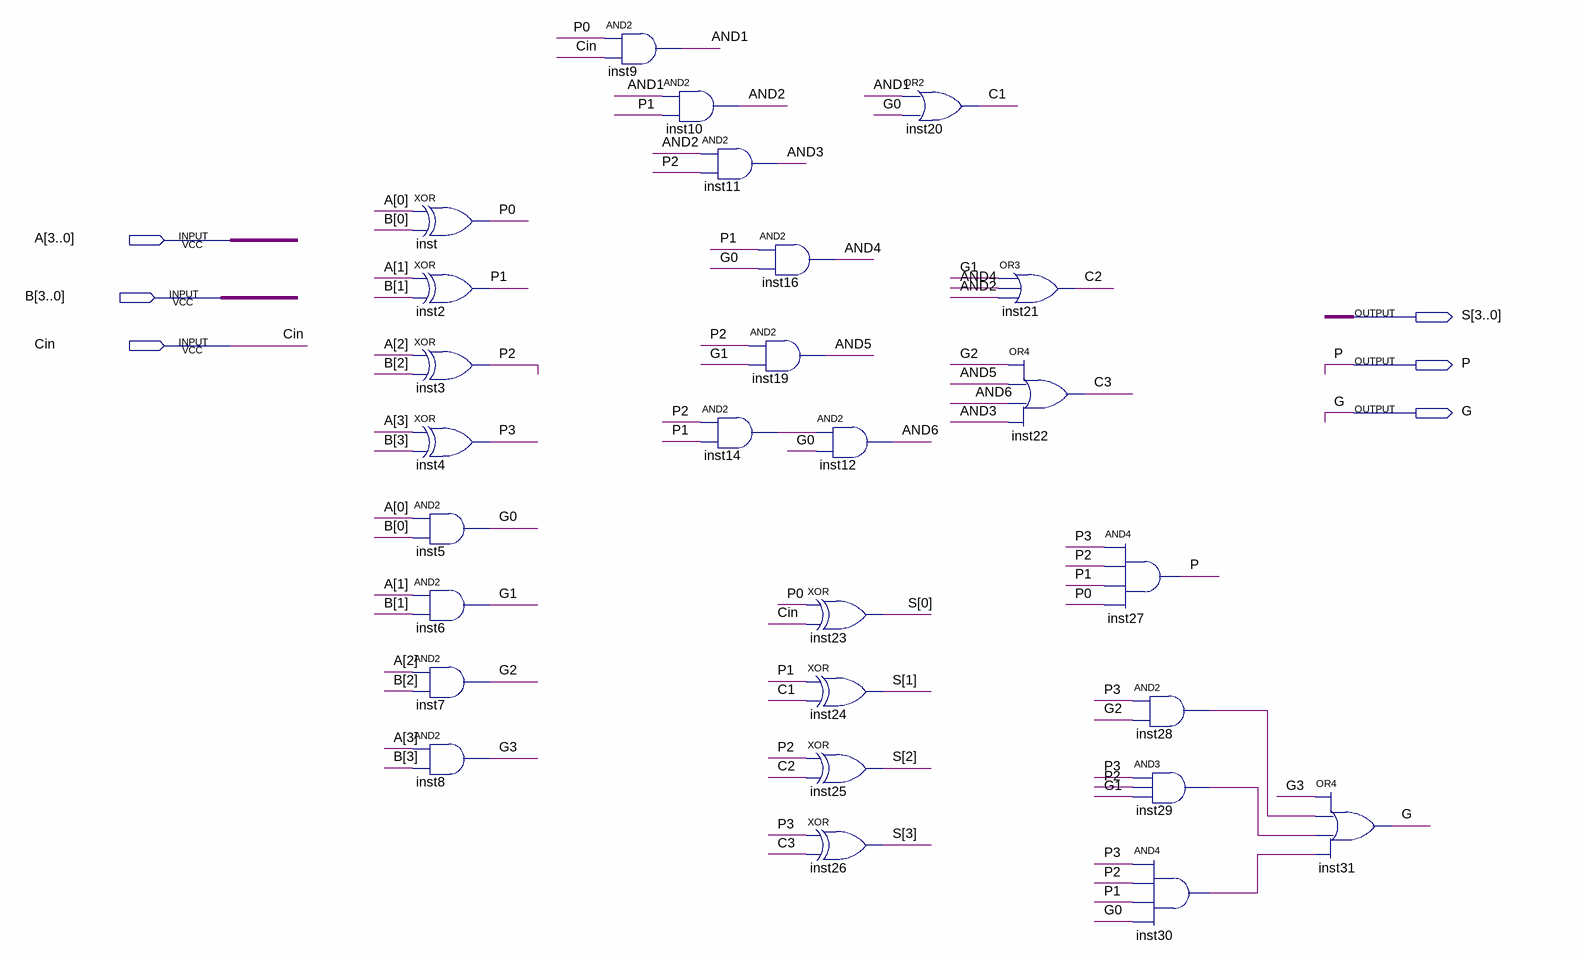
[diagram p0: schematic sheet]
// Quartus schematic CLA_4bit.bdf as structural Verilog: 27 symbols, 6 pins
module CLA_4bit (
  input  [3:0] A,
  input  [3:0] B,
  input  Cin,
  output [3:0] S,
  output P,
  output G
);

  wire AND1, AND2, AND3, AND4, AND5, AND6, C1, C2, C3, G0, G1, G2, G3, inst14_out, inst28_out, inst29_out,
       inst30_out, P0, P1, P2, P3;

  xor inst (P0, A[0], B[0]);
  xor inst2 (P1, A[1], B[1]);
  xor inst3 (P2, A[2], B[2]);
  xor inst4 (P3, A[3], B[3]);
  and inst5 (G0, A[0], B[0]);
  and inst6 (G1, A[1], B[1]);
  and inst7 (G2, A[2], B[2]);
  and inst8 (G3, A[3], B[3]);
  and inst9 (AND1, P0, Cin);
  and inst10 (AND2, AND1, P1);
  and inst11 (AND3, AND2, P2);
  and inst19 (AND5, P2, G1);
  and inst14 (inst14_out, P2, P1);
  and inst16 (AND4, P1, G0);
  and inst12 (AND6, inst14_out, G0);
  xor inst23 (S[0], P0, Cin);
  xor inst24 (S[1], P1, C1);
  xor inst25 (S[2], P2, C2);
  xor inst26 (S[3], P3, C3);
  or inst20 (C1, AND1, G0);
  or inst21 (C2, G1, AND4, AND2);
  or inst22 (C3, G2, AND5, AND6, AND3);
  and inst27 (P, P3, P2, P1, P0);
  and inst28 (inst28_out, P3, G2);
  and inst29 (inst29_out, P3, P2, G1);
  and inst30 (inst30_out, P3, P2, P1, G0);
  or inst31 (G, G3, inst28_out, inst29_out, inst30_out);
endmodule
